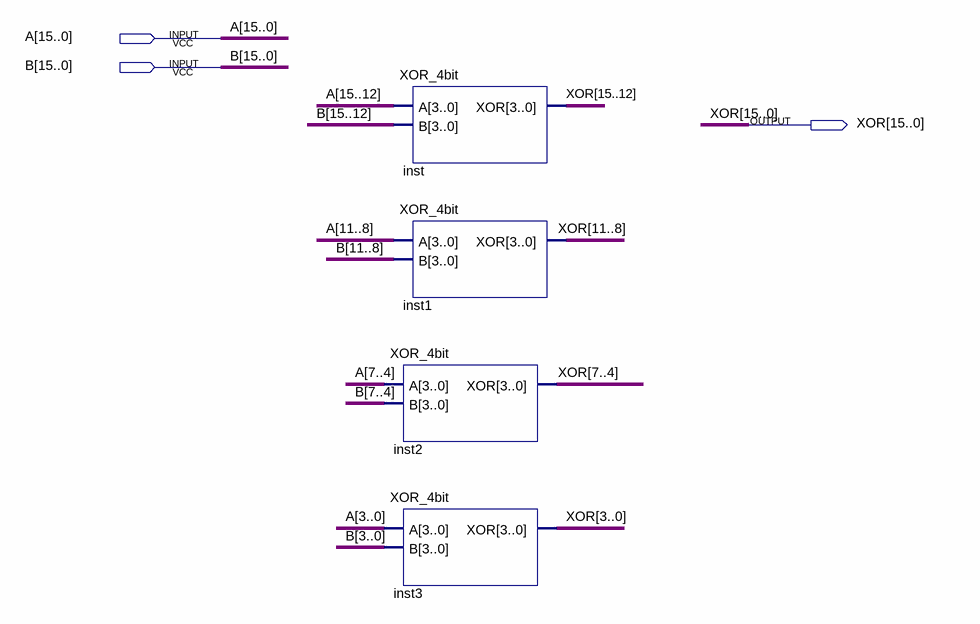
[diagram p0: schematic sheet]
// Quartus schematic XOR_16bit.bdf as structural Verilog: 4 symbols, 3 pins
module XOR_16bit (
  input  [15:0] A,
  input  [15:0] B,
  output [15:0] XOR
);

  XOR_4bit inst (.A(A[15:12]), .B(B[15:12]), .XOR(XOR[15:12]));
  XOR_4bit inst1 (.A(A[11:8]), .B(B[11:8]), .XOR(XOR[11:8]));
  XOR_4bit inst2 (.A(A[7:4]), .B(B[7:4]), .XOR(XOR[7:4]));
  XOR_4bit inst3 (.A(A[3:0]), .B(B[3:0]), .XOR(XOR[3:0]));
endmodule
